# Altium schematic sheet Power_Section.SchDoc
size A4
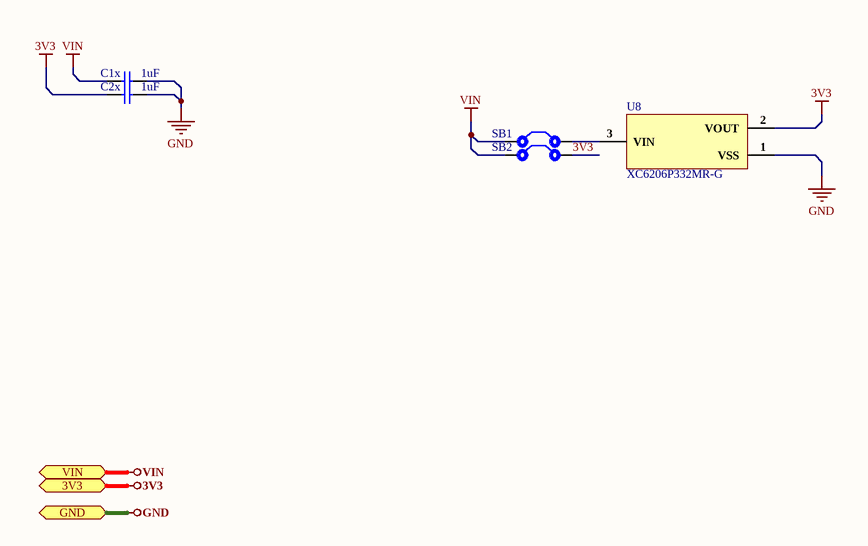
[diagram p0: Power_Section.SchDoc]

## Parts
C1x  1uF  [Cap0603]
C2x  1uF  [Cap0603]
SB1  Solder Bridge  [Solder Bridge]  (value not drawn)
SB2  Solder Bridge  [Solder Bridge]  (value not drawn)
U8  XC6206P332MR-G  [sot-23]

## Ports
3V3 (bidir), GND (bidir), VIN (bidir)

## Nets
3V3: C2x.1 SB2.2 U8.2(VOUT) ; port 3V3
GND: C1x.2 C2x.2 U8.1(VSS) ; port GND
VIN: C1x.1 SB1.1 SB2.1 ; port VIN
NetSB1_2: SB1.2 U8.3(VIN)

## Library data of the parts
C1x C2x = CC0603KRX5R8BB105: CAP CER 1UF 25V X5R 0603; Manufacturer: Yageo; Tolerance: 10%; Supplier 1: Digi-Key; Manufacturer Part Number: CC0603KRX5R8BB105; RoHS: Yes; Category: Ceramic Capacitors; Stock 1: 919939; Pricing 1: 1=0.12000, 10=0.08400, 50=0.04760, 100=0.03940, 500=0.02764, 1000=0.02288 (USD); Mount: Surface Mount; Case/Package: 0603; Number of Pins: 2; Case Code (Metric): 1608; Case Code (Imperial): 0603; Min Operating Temperature: -55°C; Max Operating Temperature: 85°C; Capacitance: 1uF; Dielectric: X5R; Package Quantity: 1; Voltage Rating: 25V; Packaging: Tape and Reel; Termination: SMD/SMT; Voltage Rating (DC): 25V; Series: CC; Construction: Flat; Length: 1.6mm; Width: 0.031inch; Height: 0.8mm; Thickness: 0.035inch; Depth: 0.8mm; Radiation Hardening: No; REACH SVHC: No SVHC; Lead Free: Lead Free; Halogen Free: Halogen Free; RoHS Compliant: Yes; ComponentLink1URL: https://datasheet.ciiva.com/176/mlccorderingcode-176785.pdf?src-supplier=Digi-Key; ComponentLink1Description: https://datasheet.ciiva.com/176/mlccorderingcode-176785.pdf?src-supplier=Digi-Key; ComponentLink2URL: https://datasheet.ciiva.com/176/mlccorderingcode-176786.pdf?src-supplier=Digi-Key; ComponentLink2Description: https://datasheet.ciiva.com/176/mlccorderingcode-176786.pdf?src-supplier=Digi-Key; ComponentLink3URL: https://datasheet.ciiva.com/176/mlccorderingcode-176787.pdf?src-supplier=Digi-Key; ComponentLink3Description: https://datasheet.ciiva.com/176/mlccorderingcode-176787.pdf?src-supplier=Digi-Key; ComponentLink4URL: https://datasheet.ciiva.com/17436/upy-gphc-x5r-4v-to-50v-12-17436952.pdf?src-supplier=Avnet+Europe; ComponentLink4Description: https://datasheet.ciiva.com/17436/upy-gphc-x5r-4v-to-50v-12-17436952.pdf?src-supplier=Avnet+Europe; ComponentLink5URL: https://datasheet.ciiva.com/7978/1525783-7978171.pdf?src-supplier=Element14; ComponentLink5Description: https://datasheet.ciiva.com/7978/1525783-7978171.pdf?src-supplier=Element14; ComponentLink6URL: https://datasheet.ciiva.com/11586/upy-gphc-x5r-4v-to-50v-12-11586318.pdf?src-supplier=Avnet; ComponentLink6Description: https://datasheet.ciiva.com/11586/upy-gphc-x5r-4v-to-50v-12-11586318.pdf?src-supplier=Avnet; Supplier Part Number 1: 311-1445-1-ND
SB1 SB2 = Solder Bridge: Solder Bridge ON
U8 = XC6206P332MR-G: IC REG LINEAR 3.3V 200MA SOT23; Manufacturer: Torex; Output Type: Fixed; Output Configuration: Positive; Number of Regulators: 1; Max Input Voltage: 6V; Dropout Voltage: 680mV; Quiescent Current: 3uA; Supplier 1: Avnet; Manufacturer Part Number: XC6206P332MR-G; RoHS: Yes; Category: Voltage Regulators - Linear; Pricing 1: 3000=0.23146, 6000=0.22820, 12000=0.22168, 18000=0.21679, 24000=0.20864, 30000=0.20375, 300000=0.19886 (USD); Mount: Surface Mount; Case/Package: TO-236-3; Min Operating Temperature: -40°C; Max Operating Temperature: 85°C; Min Output Voltage: 3.3V; Output Current: 200mA; Max Supply Current: 3uA; RoHS Compliant: Yes; ComponentLink1URL: https://www.torexsemi.com/file/xc6206/XC6206.pdf?src-supplier=Digi-Key; ComponentLink1Description: https://www.torexsemi.com/file/xc6206/XC6206.pdf?src-supplier=Digi-Key; Supplier Part Number 1: XC6206P332MR-G